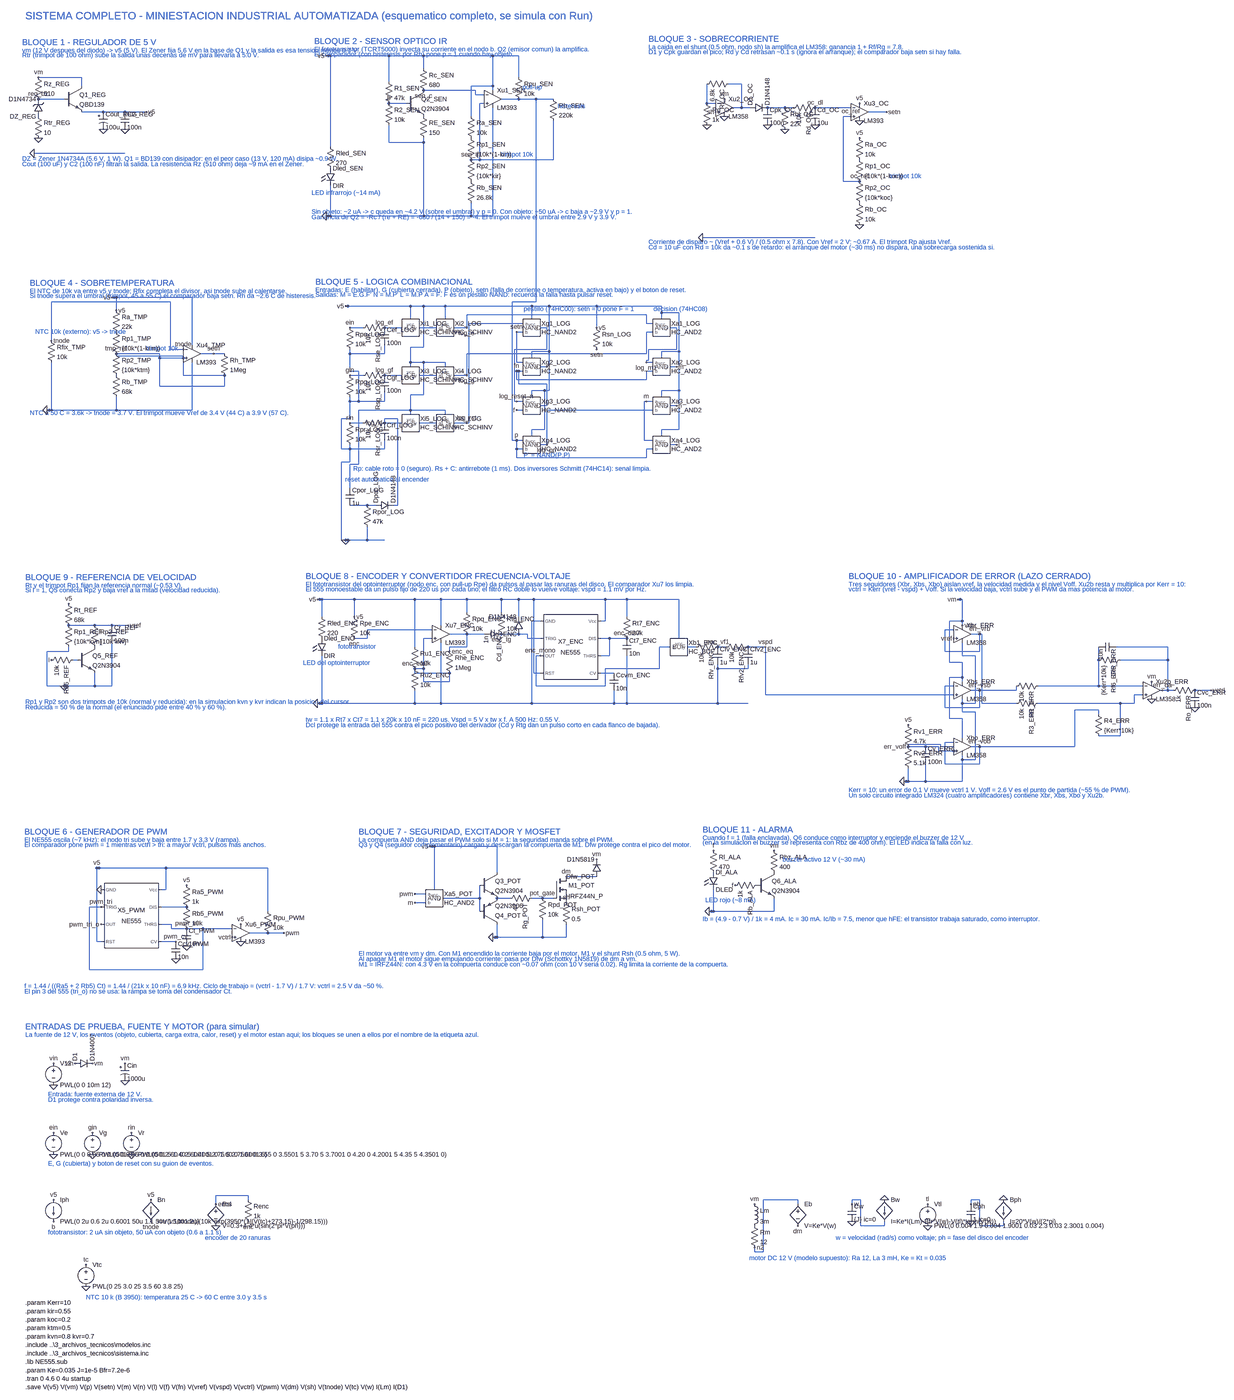
[diagram p0: schematic SISTEMA_COMPLETO.asc, whole sheet]
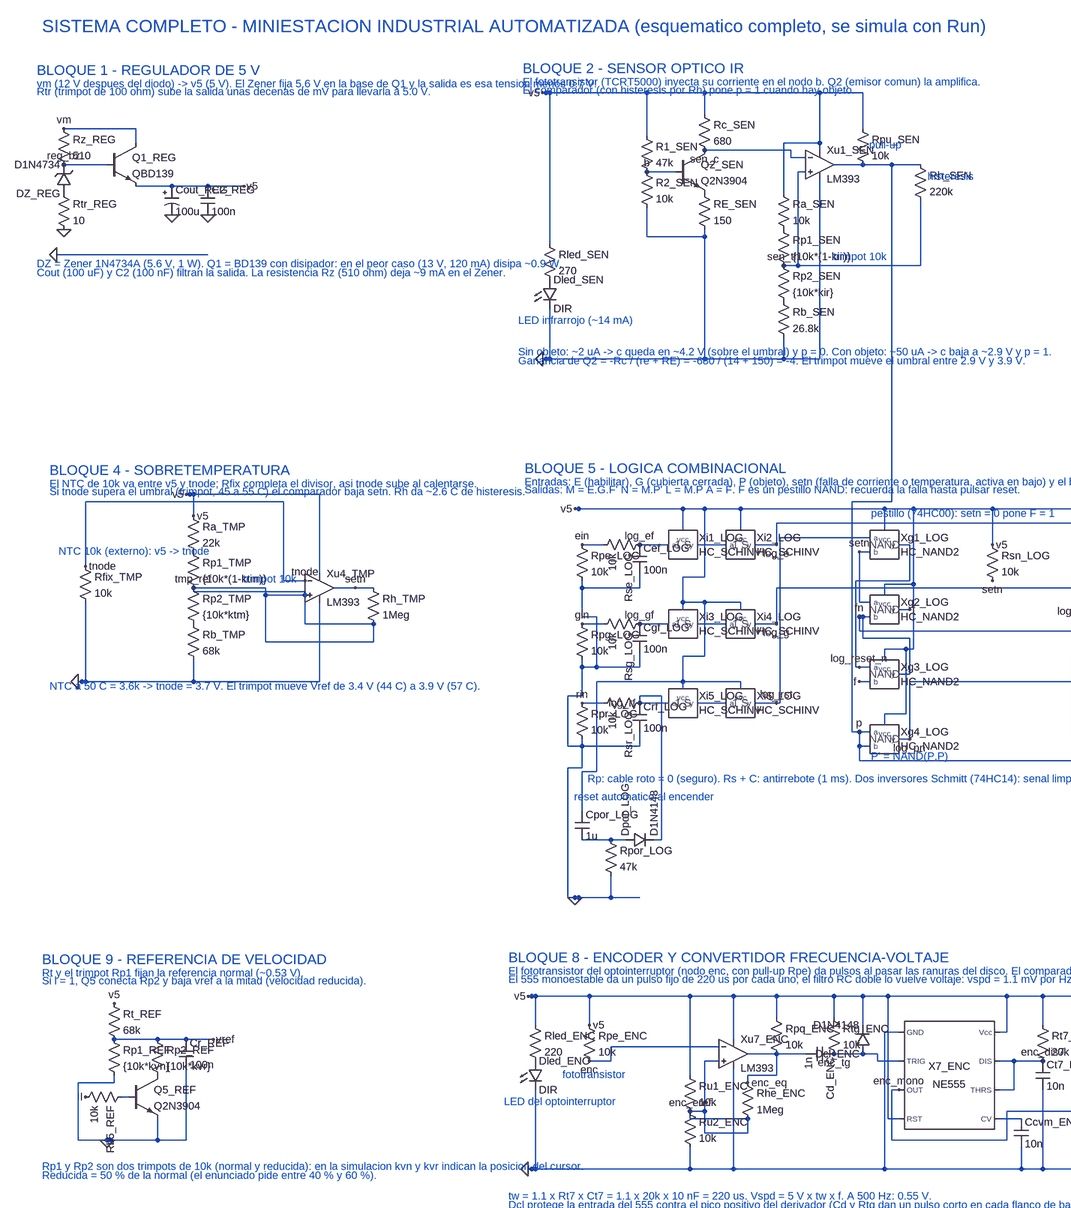
[diagram p1: schematic SISTEMA_COMPLETO.asc, part, row 1 of 2, column 1 of 2]
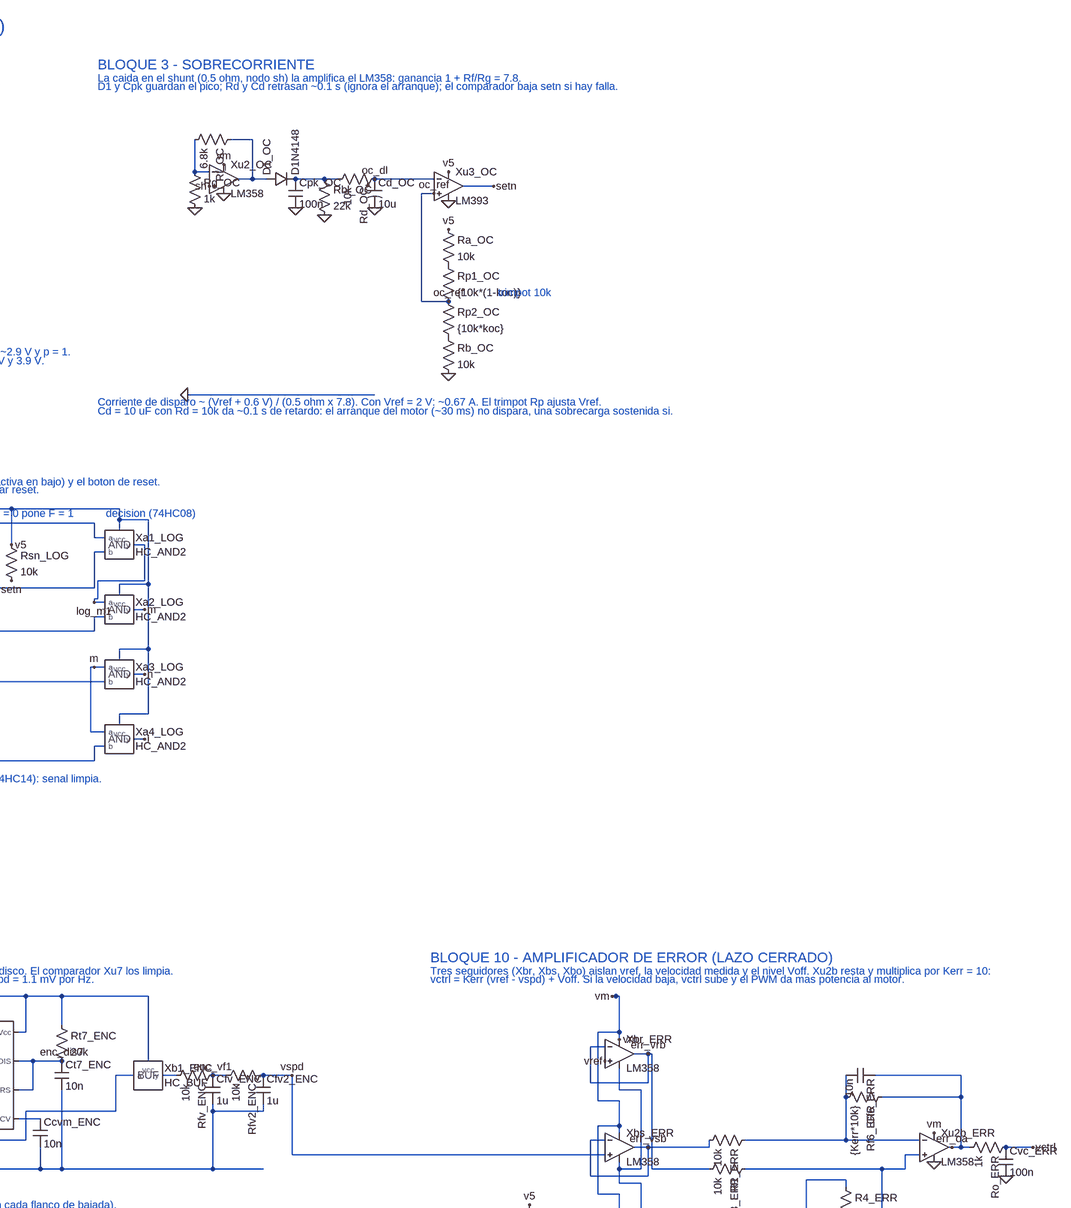
[diagram p2: schematic SISTEMA_COMPLETO.asc, part, row 1 of 2, column 2 of 2]
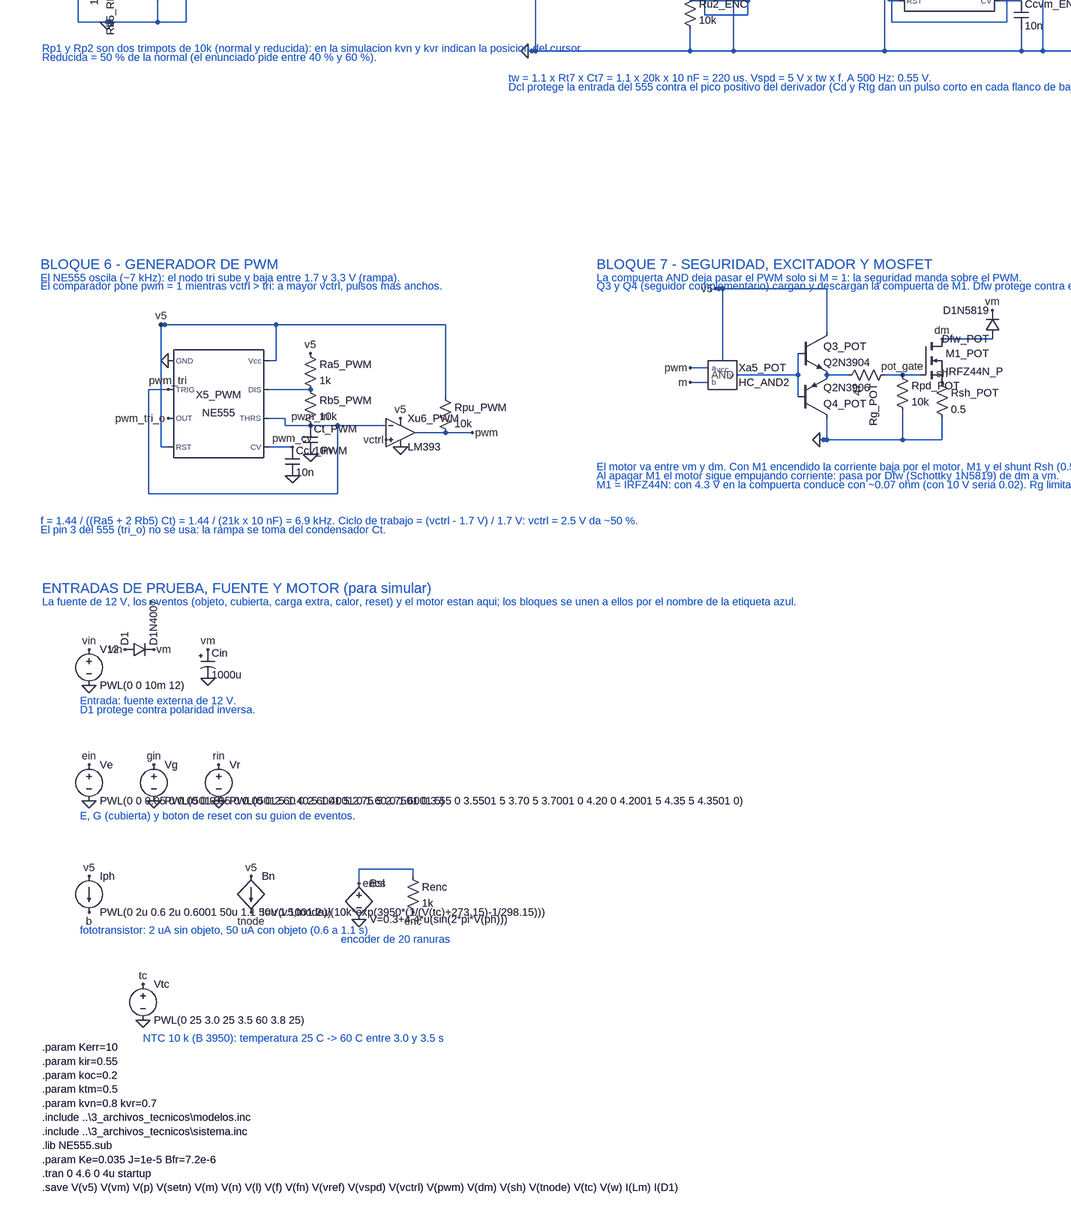
[diagram p3: schematic SISTEMA_COMPLETO.asc, part, row 2 of 2, column 1 of 2]
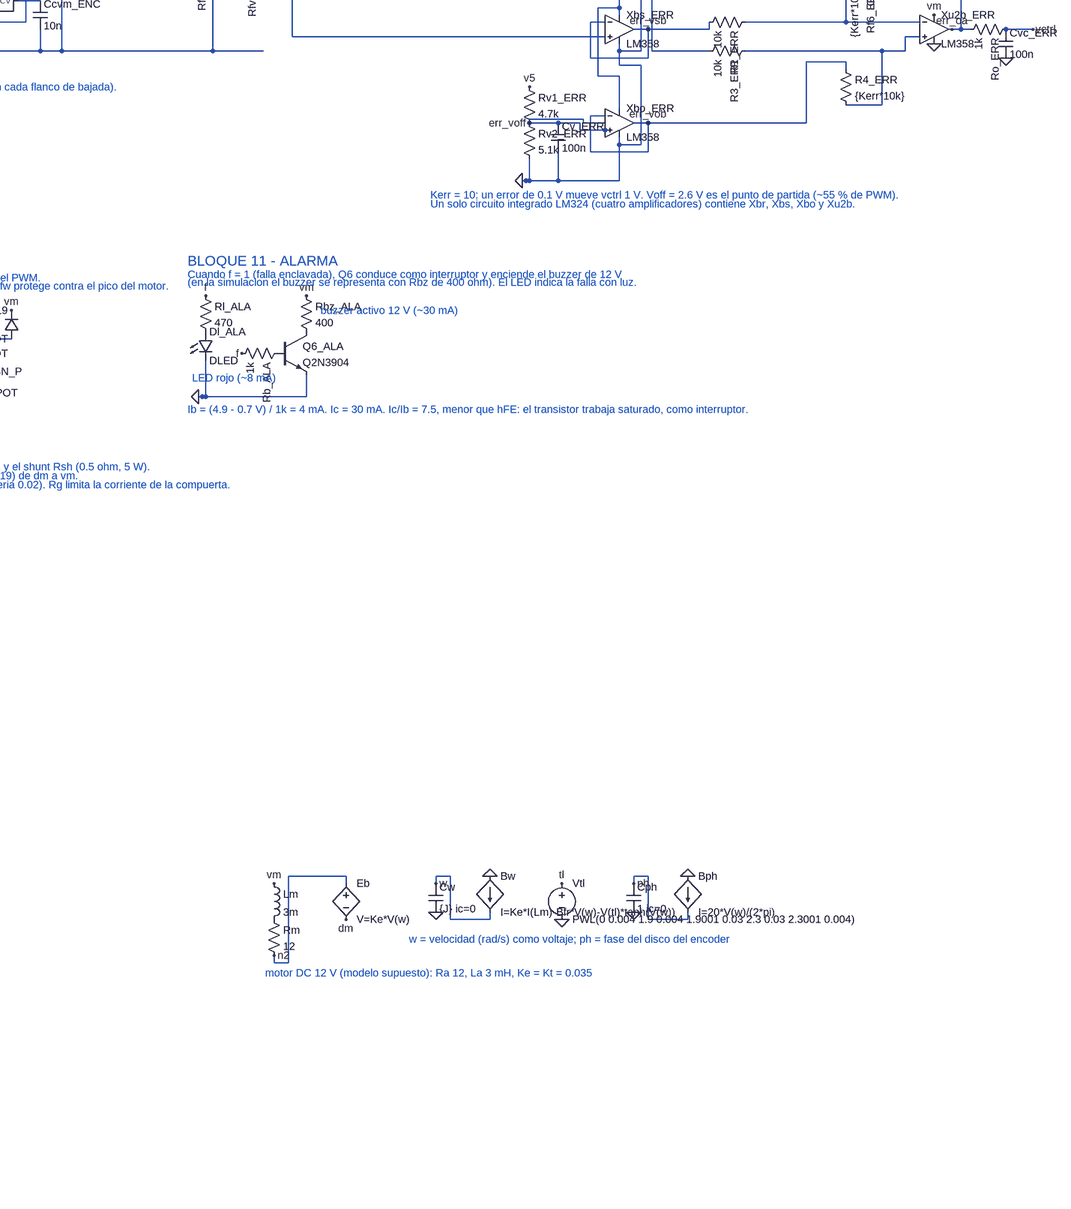
[diagram p4: schematic SISTEMA_COMPLETO.asc, part, row 2 of 2, column 2 of 2]
SISTEMA_COMPLETO.asc, the LTspice schematic file:
Version 4
SHEET 1 9000 5940
WIRE 48 208 144 208
WIRE 48 128 208 128
WIRE 208 128 208 160
WIRE 208 256 448 256
WIRE 32 408 368 408
WIRE 1344 224 1408 224
WIRE 1472 176 1664 176
WIRE 1664 176 1664 192
WIRE 1664 192 1696 192
WIRE 1648 432 1680 432
WIRE 1680 432 1680 224
WIRE 1680 224 1696 224
WIRE 1760 208 1824 208
WIRE 1824 208 1888 208
WIRE 1888 208 1952 208
WIRE 1952 288 1952 432
WIRE 1952 432 1680 432
WIRE 1112 48 1824 48
WIRE 1112 48 1120 48
WIRE 1472 96 1472 48
WIRE 1824 128 1824 48
WIRE 1344 144 1344 48
WIRE 1728 176 1728 48
WIRE 1648 272 1648 160
WIRE 1648 160 1728 160
WIRE 1128 384 1128 48
WIRE 1112 640 1728 640
WIRE 1112 640 1120 640
WIRE 1648 592 1648 640
WIRE 1128 528 1128 640
WIRE 1472 352 1472 640
WIRE 1344 304 1344 368
WIRE 1344 368 1472 368
WIRE 1728 240 1728 640
WIRE 2552 224 2520 224
WIRE 2520 224 2520 152
WIRE 2600 152 2648 152
WIRE 2648 152 2648 240
WIRE 2648 240 2616 240
WIRE 2648 240 2680 240
WIRE 2744 240 2808 240
WIRE 2808 240 2840 240
WIRE 2920 240 3052 240
WIRE 3116 256 3184 256
WIRE 3084 512 3024 512
WIRE 3024 512 3024 272
WIRE 3024 272 3052 272
WIRE 2504 720 2920 720
WIRE 648 1504 696 1504
WIRE 696 1504 736 1504
WIRE 96 1456 96 1312
WIRE 96 1312 536 1312
WIRE 536 1312 536 1488
WIRE 536 1488 584 1488
WIRE 336 1504 496 1504
WIRE 496 1504 496 1520
WIRE 496 1520 584 1520
WIRE 736 1584 736 1624
WIRE 736 1624 496 1624
WIRE 496 1624 496 1520
WIRE 320 1296 616 1296
WIRE 320 1296 328 1296
WIRE 336 1344 336 1296
WIRE 616 1472 616 1296
WIRE 80 1712 616 1712
WIRE 80 1712 88 1712
WIRE 336 1664 336 1712
WIRE 96 1536 96 1712
WIRE 616 1536 616 1712
WIRE 1200 1408 1248 1408
WIRE 1328 1408 1392 1408
WIRE 1456 1408 1520 1408
WIRE 1584 1408 1632 1408
WIRE 1200 1584 1248 1584
WIRE 1328 1584 1392 1584
WIRE 1456 1584 1520 1584
WIRE 1584 1584 1632 1584
WIRE 1200 1760 1248 1760
WIRE 1328 1760 1392 1760
WIRE 1456 1760 1520 1760
WIRE 1584 1760 1632 1760
WIRE 1200 2064 1264 2064
WIRE 1264 2064 1296 2064
WIRE 1904 1408 1928 1408
WIRE 1872 1376 1872 1352
WIRE 1840 1392 1816 1392
WIRE 1840 1424 1816 1424
WIRE 1904 1552 1928 1552
WIRE 1872 1520 1872 1496
WIRE 1840 1536 1816 1536
WIRE 1840 1568 1816 1568
WIRE 1904 1696 1928 1696
WIRE 1872 1664 1872 1640
WIRE 1840 1680 1816 1680
WIRE 1840 1712 1816 1712
WIRE 1904 1840 1928 1840
WIRE 1872 1808 1872 1784
WIRE 1840 1824 1816 1824
WIRE 1840 1856 1816 1856
WIRE 2384 1408 2408 1408
WIRE 2352 1376 2352 1352
WIRE 2320 1392 2296 1392
WIRE 2320 1424 2296 1424
WIRE 2384 1552 2408 1552
WIRE 2352 1520 2352 1496
WIRE 2320 1536 2296 1536
WIRE 2320 1568 2296 1568
WIRE 2384 1696 2408 1696
WIRE 2352 1664 2352 1640
WIRE 2320 1680 2296 1680
WIRE 2320 1712 2296 1712
WIRE 2384 1840 2408 1840
WIRE 2352 1808 2352 1784
WIRE 2320 1824 2296 1824
WIRE 2320 1856 2296 1856
WIRE 2296 1392 2296 1360
WIRE 2296 1360 1632 1360
WIRE 1632 1360 1632 1408
WIRE 2296 1568 2296 1600
WIRE 2296 1600 1816 1600
WIRE 1816 1600 1816 1568
WIRE 2296 1424 2296 1504
WIRE 2296 1504 1632 1504
WIRE 1632 1504 1632 1584
WIRE 2296 1824 2288 1824
WIRE 2288 1824 2288 1680
WIRE 2288 1680 2296 1680
WIRE 2408 1408 2408 1488
WIRE 2408 1488 2304 1488
WIRE 2304 1488 2304 1528
WIRE 2304 1528 2296 1528
WIRE 2296 1528 2296 1536
WIRE 2296 1856 2296 1888
WIRE 2296 1888 1816 1888
WIRE 1816 1888 1816 1856
WIRE 2296 1712 1928 1712
WIRE 1928 1712 1928 1840
WIRE 1928 1408 1928 1488
WIRE 1928 1488 1808 1488
WIRE 1808 1488 1808 1680
WIRE 1808 1680 1816 1680
WIRE 1360 2064 1376 2064
WIRE 1376 2064 1376 1744
WIRE 1376 1744 1328 1744
WIRE 1328 1744 1328 1760
WIRE 1816 1392 1640 1392
WIRE 1640 1392 1640 1760
WIRE 1640 1760 1632 1760
WIRE 1816 1536 1816 1424
WIRE 1184 1328 2352 1328
WIRE 1184 1328 1192 1328
WIRE 1872 1352 1872 1328
WIRE 2352 1352 2352 1328
WIRE 1424 1376 1424 1328
WIRE 1552 1376 1552 1328
WIRE 2112 1408 2112 1328
WIRE 1872 1496 1936 1496
WIRE 1936 1496 1936 1328
WIRE 2352 1496 2416 1496
WIRE 2416 1496 2416 1352
WIRE 2416 1352 2352 1352
WIRE 1872 1640 1936 1640
WIRE 1936 1640 1936 1496
WIRE 2352 1640 2416 1640
WIRE 2416 1640 2416 1496
WIRE 1872 1784 1920 1784
WIRE 1920 1784 1920 1640
WIRE 2352 1784 2416 1784
WIRE 2416 1784 2416 1640
WIRE 1424 1552 1424 1480
WIRE 1424 1480 1472 1480
WIRE 1472 1480 1472 1328
WIRE 1552 1552 1552 1536
WIRE 1552 1536 1424 1536
WIRE 1424 1728 1424 1656
WIRE 1424 1656 1472 1656
WIRE 1472 1656 1472 1536
WIRE 1552 1728 1552 1712
WIRE 1552 1712 1424 1712
WIRE 1200 2000 1200 1912
WIRE 1200 1912 1232 1912
WIRE 1232 1912 1232 1712
WIRE 1232 1712 1424 1712
WIRE 1184 2192 1328 2192
WIRE 1184 2192 1192 2192
WIRE 1264 2144 1264 2192
WIRE 1200 1840 1200 1904
WIRE 1200 1904 1168 1904
WIRE 1168 1904 1168 2192
WIRE 1168 2192 1184 2192
WIRE 1328 1824 1328 1856
WIRE 1328 1856 1200 1856
WIRE 1200 1664 1200 1744
WIRE 1200 1744 1168 1744
WIRE 1168 1744 1168 1856
WIRE 1168 1856 1200 1856
WIRE 1328 1648 1328 1680
WIRE 1328 1680 1200 1680
WIRE 1200 1488 1200 1568
WIRE 1200 1568 1232 1568
WIRE 1232 1568 1232 1680
WIRE 1328 1472 1328 1504
WIRE 1328 1504 1200 1504
WIRE 160 2656 256 2656
WIRE 256 2656 320 2656
WIRE 320 2656 380 2656
WIRE 176 2784 192 2784
WIRE 144 2880 320 2880
WIRE 144 2880 152 2880
WIRE 256 2832 256 2880
WIRE 160 2736 160 2752
WIRE 160 2752 80 2752
WIRE 80 2752 80 2880
WIRE 80 2880 144 2880
WIRE 320 2720 320 2880
WIRE 1216 2704 1264 2704
WIRE 1264 2704 1264 2672
WIRE 1264 2672 1504 2672
WIRE 1440 2816 1472 2816
WIRE 1472 2816 1472 2704
WIRE 1472 2704 1504 2704
WIRE 1568 2688 1632 2688
WIRE 1632 2688 1696 2688
WIRE 1568 2832 1568 2864
WIRE 1568 2864 1472 2864
WIRE 1472 2864 1472 2816
WIRE 1760 2688 1824 2688
WIRE 1824 2688 1856 2688
WIRE 1856 2688 1856 2704
WIRE 1856 2704 1904 2704
WIRE 2128 2704 2160 2704
WIRE 2160 2704 2160 2768
WIRE 2160 2768 2128 2768
WIRE 2160 2704 2224 2704
WIRE 2128 2832 2176 2832
WIRE 2384 2736 2344 2736
WIRE 2448 2736 2480 2736
WIRE 2560 2736 2592 2736
WIRE 2672 2736 2736 2736
WIRE 1632 2688 1632 2736
WIRE 1632 2736 1568 2736
WIRE 1568 2736 1568 2752
WIRE 2344 2736 2344 2816
WIRE 2344 2816 2144 2816
WIRE 2144 2816 2144 2880
WIRE 2144 2880 1888 2880
WIRE 1888 2880 1888 2768
WIRE 1888 2768 1904 2768
WIRE 1080 2560 2416 2560
WIRE 1080 2560 1088 2560
WIRE 1632 2608 1632 2560
WIRE 1760 2608 1760 2560
WIRE 1096 2624 1096 2560
WIRE 1216 2624 1216 2560
WIRE 1824 2624 1824 2560
WIRE 2224 2624 2224 2560
WIRE 2128 2640 2144 2640
WIRE 2144 2640 2144 2560
WIRE 1536 2656 1536 2560
WIRE 2416 2704 2416 2560
WIRE 1440 2736 1440 2560
WIRE 1904 2832 1880 2832
WIRE 1880 2832 1880 2560
WIRE 1080 2944 2672 2944
WIRE 1080 2944 1088 2944
WIRE 1440 2896 1440 2944
WIRE 2176 2896 2176 2944
WIRE 2560 2800 2560 2944
WIRE 2672 2800 2672 2816
WIRE 2672 2816 2560 2816
WIRE 1096 2768 1096 2944
WIRE 2224 2768 2224 2944
WIRE 1536 2720 1536 2944
WIRE 1904 2640 1872 2640
WIRE 1872 2640 1872 2944
WIRE 3496 2688 3528 2688
WIRE 3528 2688 3528 2752
WIRE 3528 2752 3400 2752
WIRE 3400 2752 3400 2672
WIRE 3400 2672 3432 2672
WIRE 3496 2896 3528 2896
WIRE 3528 2896 3528 2960
WIRE 3528 2960 3400 2960
WIRE 3400 2960 3400 2880
WIRE 3400 2880 3432 2880
WIRE 3496 3104 3528 3104
WIRE 3528 3104 3528 3168
WIRE 3528 3168 3400 3168
WIRE 3400 3168 3400 3088
WIRE 3400 3088 3432 3088
WIRE 3264 3104 3328 3104
WIRE 3328 3104 3376 3104
WIRE 3376 3104 3376 3120
WIRE 3376 3120 3432 3120
WIRE 3744 2880 3968 2880
WIRE 3968 2880 4132 2880
WIRE 3744 2944 3968 2944
WIRE 3968 2944 4048 2944
WIRE 4048 2944 4100 2944
WIRE 4100 2944 4100 2912
WIRE 4100 2912 4132 2912
WIRE 3968 3064 4048 3064
WIRE 4048 3064 4048 2944
WIRE 3968 2880 3968 2784
WIRE 4048 2784 4224 2784
WIRE 3968 2784 3968 2736
WIRE 4032 2736 4224 2736
WIRE 4224 2736 4224 2784
WIRE 4224 2784 4224 2896
WIRE 4196 2896 4224 2896
WIRE 4224 2896 4244 2896
WIRE 4324 2896 4384 2896
WIRE 3968 2984 3968 2968
WIRE 3968 2968 3880 2968
WIRE 3880 2968 3880 3104
WIRE 3880 3104 3528 3104
WIRE 3664 2944 3536 2944
WIRE 3536 2944 3536 2688
WIRE 3536 2688 3528 2688
WIRE 3664 2880 3664 2896
WIRE 3664 2896 3528 2896
WIRE 3448 2560 3464 2560
WIRE 3448 2560 3456 2560
WIRE 3464 2656 3464 2560
WIRE 3464 2864 3464 2792
WIRE 3464 2792 3416 2792
WIRE 3416 2792 3416 2640
WIRE 3416 2640 3464 2640
WIRE 3464 3072 3464 3000
WIRE 3464 3000 3416 3000
WIRE 3416 3000 3416 2848
WIRE 3416 2848 3464 2848
WIRE 3248 3232 3464 3232
WIRE 3248 3232 3256 3232
WIRE 3264 3184 3264 3232
WIRE 3328 3168 3328 3232
WIRE 3464 3136 3464 3232
WIRE 3464 2928 3464 2976
WIRE 3464 2976 3512 2976
WIRE 3512 2976 3512 3152
WIRE 3512 3152 3464 3152
WIRE 3464 2720 3464 2768
WIRE 3464 2768 3512 2768
WIRE 3512 2768 3512 2944
WIRE 3512 2944 3464 2944
WIRE 504 3968 596 3968
WIRE 504 4032 540 4032
WIRE 540 4032 540 4048
WIRE 540 4048 596 4048
WIRE 504 4096 556 4096
WIRE 596 4048 656 4048
WIRE 656 4048 764 4048
WIRE 280 3968 236 3968
WIRE 236 3968 236 4200
WIRE 236 4200 656 4200
WIRE 656 4200 656 4048
WIRE 828 4064 896 4064
WIRE 896 4064 956 4064
WIRE 264 3824 896 3824
WIRE 264 3824 272 3824
WIRE 504 3904 520 3904
WIRE 520 3904 520 3824
WIRE 896 3984 896 3824
WIRE 280 4096 264 4096
WIRE 264 4096 264 3824
WIRE 1480 3920 1440 3920
WIRE 1480 3952 1440 3952
WIRE 1544 3936 1680 3936
WIRE 1680 3888 1680 3936
WIRE 1680 3936 1680 3984
WIRE 1744 3936 1792 3936
WIRE 1872 3936 1952 3936
WIRE 2000 3856 2112 3856
WIRE 1496 3744 1744 3744
WIRE 1496 3744 1504 3744
WIRE 1744 3840 1744 3744
WIRE 1512 3904 1512 3744
WIRE 1728 4080 2000 4080
WIRE 1728 4080 1736 4080
WIRE 1744 4032 1744 4080
WIRE 2000 4032 2000 4080
WIRE 1912 4016 1912 4080
WIRE 2528 3984 2768 3984
WIRE 2528 3984 2536 3984
WIRE 2768 3936 2768 3984
WIRE 2544 3904 2544 3984
WIRE 824 5160 824 5144
WIRE 824 5144 704 5144
WIRE 704 5144 704 5176
WIRE 1928 1696 1928 1616
WIRE 1928 1616 1824 1616
WIRE 1824 1616 1824 1568
WIRE 1824 1568 1816 1568
WIRE 2856 5176 2856 5160
WIRE 2856 5160 2728 5160
WIRE 2728 5160 2728 5352
WIRE 2728 5352 2696 5352
WIRE 2696 5352 2696 5336
WIRE 3616 5240 3616 5256
WIRE 3616 5256 3528 5256
WIRE 3528 5256 3528 5160
WIRE 3528 5160 3496 5160
WIRE 3496 5160 3496 5176
WIRE 3432 2912 2736 2912
WIRE 2736 2912 2736 2736
WIRE 3176 5240 3176 5256
WIRE 3176 5256 3088 5256
WIRE 3088 5256 3088 5160
WIRE 3088 5160 3056 5160
WIRE 3056 5160 3056 5176
WIRE 1816 1856 1816 1824
WIRE 1888 208 1888 1312
WIRE 1888 1312 1800 1312
WIRE 1800 1312 1800 1824
WIRE 1800 1824 1816 1824
WIRE 1568 2832 1440 2832
WIRE 1440 2832 1440 2816
WIRE 3432 3120 3432 3104
WIRE 3432 3104 3384 3104
WIRE 3384 3104 3384 3096
WIRE 3384 3096 3264 3096
WIRE 3264 3096 3264 3104
WIRE 584 1520 584 1512
WIRE 584 1512 336 1512
WIRE 336 1512 336 1504
WIRE 736 1584 584 1584
WIRE 584 1584 584 1520
FLAG 48 128 vm
FLAG 48 352 0
FLAG 48 208 reg_bz
FLAG 448 256 v5
FLAG 288 320 0
FLAG 368 320 0
FLAG 32 408 0
FLAG 1344 224 b
FLAG 1472 176 sen_c
FLAG 1648 432 sen_th
FLAG 1112 48 v5
FLAG 1112 640 0
FLAG 2552 256 sh
FLAG 2584 208 vm
FLAG 2584 272 0
FLAG 2520 304 0
FLAG 2744 304 0
FLAG 2808 320 0
FLAG 2920 304 0
FLAG 2920 240 oc_dl
FLAG 3052 272 oc_ref
FLAG 3084 224 v5
FLAG 3084 288 0
FLAG 3184 256 setn
FLAG 3084 352 v5
FLAG 3084 512 oc_ref
FLAG 3084 672 0
FLAG 2504 720 0
FLAG 96 1456 tnode
FLAG 336 1344 v5
FLAG 336 1504 tmp_ref
FLAG 584 1488 tnode
FLAG 696 1504 setn
FLAG 320 1296 v5
FLAG 80 1712 0
FLAG 1200 1408 ein
FLAG 1328 1408 log_ef
FLAG 1632 1408 log_e
FLAG 1200 1584 gin
FLAG 1328 1584 log_gf
FLAG 1632 1584 log_g
FLAG 1200 1760 rin
FLAG 1328 1760 log_rf
FLAG 1632 1760 log_rst
FLAG 1816 1424 setn
FLAG 1928 1552 f
FLAG 1816 1568 fn
FLAG 1816 1680 log_reset_n
FLAG 1816 1712 f
FLAG 1928 1840 log_pn
FLAG 1816 1824 p
FLAG 2112 1408 v5
FLAG 2112 1488 setn
FLAG 2408 1552 m
FLAG 2296 1536 log_m1
FLAG 2408 1696 n
FLAG 2296 1680 m
FLAG 2408 1840 l
FLAG 1184 1328 v5
FLAG 1184 2192 0
FLAG 160 2576 v5
FLAG 380 2656 vref
FLAG 96 2784 l
FLAG 144 2880 0
FLAG 1216 2624 v5
FLAG 1216 2704 enc
FLAG 1440 2816 enc_eref
FLAG 1568 2752 enc_eq
FLAG 1760 2688 enc_tg
FLAG 1904 2768 enc_mono
FLAG 2224 2704 enc_dis7
FLAG 2560 2736 enc_vf1
FLAG 2736 2736 vspd
FLAG 1080 2560 v5
FLAG 1080 2944 0
FLAG 3432 2704 vref
FLAG 3464 2656 vm
FLAG 3528 2688 err_vrb
FLAG 3528 2896 err_vsb
FLAG 3528 3104 err_vob
FLAG 3264 3024 v5
FLAG 3264 3104 err_voff
FLAG 4164 2864 vm
FLAG 4164 2928 0
FLAG 4204 2896 err_oa
FLAG 4324 2960 0
FLAG 4384 2896 vctrl
FLAG 3448 2560 vm
FLAG 3248 3232 0
FLAG 280 3904 0
FLAG 280 3968 pwm_tri
FLAG 280 4032 pwm_tri_o
FLAG 596 3888 v5
FLAG 596 4112 0
FLAG 596 4048 pwm_tri
FLAG 556 4160 0
FLAG 556 4096 pwm_cv
FLAG 764 4080 vctrl
FLAG 796 4032 v5
FLAG 796 4096 0
FLAG 956 4064 pwm
FLAG 264 3824 v5
FLAG 1440 3920 pwm
FLAG 1440 3952 m
FLAG 1912 3936 pot_gate
FLAG 2000 3856 dm
FLAG 2000 3952 sh
FLAG 2112 3792 vm
FLAG 1496 3744 v5
FLAG 1728 4080 0
FLAG 2624 3888 f
FLAG 2768 3760 vm
FLAG 2544 3760 f
FLAG 2528 3984 0
FLAG 104 4656 vin
FLAG 104 4736 0
FLAG 184 4656 vin
FLAG 248 4656 vm
FLAG 368 4656 vm
FLAG 368 4720 0
FLAG 104 4912 ein
FLAG 104 4992 0
FLAG 248 4912 gin
FLAG 248 4992 0
FLAG 392 4912 rin
FLAG 392 4992 0
FLAG 104 5160 v5
FLAG 104 5240 b
FLAG 224 5400 tc
FLAG 224 5480 0
FLAG 464 5160 v5
FLAG 464 5240 tnode
FLAG 704 5176 encs
FLAG 704 5256 0
FLAG 824 5240 enc
FLAG 2696 5176 vm
FLAG 2696 5336 n2
FLAG 2856 5256 dm
FLAG 3056 5176 w
FLAG 3056 5240 0
FLAG 3176 5160 0
FLAG 3336 5176 tl
FLAG 3336 5256 0
FLAG 3496 5176 ph
FLAG 3496 5240 0
FLAG 3616 5160 0
SYMBOL res 32 112 R0
SYMATTR InstName Rz_REG
SYMATTR Value 510
SYMBOL zener 64 272 R180
SYMATTR InstName DZ_REG
SYMATTR Value D1N4734
SYMBOL res 32 256 R0
SYMATTR InstName Rtr_REG
SYMATTR Value 10
SYMBOL npn 144 160 R0
SYMATTR InstName Q1_REG
SYMATTR Value QBD139
SYMBOL polcap 272 256 R0
SYMATTR InstName Cout_REG
SYMATTR Value 100u
SYMBOL cap 352 256 R0
SYMATTR InstName C2_REG
SYMATTR Value 100n
SYMBOL res 1112 368 R0
SYMATTR InstName Rled_SEN
SYMATTR Value 270
SYMBOL LED 1112 464 R0
SYMATTR InstName Dled_SEN
SYMATTR Value DIR
SYMBOL res 1328 128 R0
SYMATTR InstName R1_SEN
SYMATTR Value 47k
SYMBOL res 1328 208 R0
SYMATTR InstName R2_SEN
SYMATTR Value 10k
SYMBOL npn 1408 176 R0
SYMATTR InstName Q2_SEN
SYMATTR Value Q2N3904
SYMBOL res 1456 80 R0
SYMATTR InstName Rc_SEN
SYMATTR Value 680
SYMBOL res 1456 256 R0
SYMATTR InstName RE_SEN
SYMATTR Value 150
SYMBOL res 1632 256 R0
SYMATTR InstName Ra_SEN
SYMATTR Value 10k
SYMBOL res 1632 336 R0
SYMATTR InstName Rp1_SEN
SYMATTR Value {10k*(1-kir)}
SYMBOL res 1632 416 R0
SYMATTR InstName Rp2_SEN
SYMATTR Value {10k*kir}
SYMBOL res 1632 496 R0
SYMATTR InstName Rb_SEN
SYMATTR Value 26.8k
SYMBOL OpAmps\opamp2 1728 144 R0
SYMATTR InstName Xu1_SEN
SYMATTR Value LM393
SYMBOL res 1808 112 R0
SYMATTR InstName Rpu_SEN
SYMATTR Value 10k
SYMBOL res 1936 192 R0
SYMATTR InstName Rh_SEN
SYMATTR Value 220k
SYMBOL OpAmps\opamp2 2584 176 R0
SYMATTR InstName Xu2_OC
SYMATTR Value LM358
SYMBOL res 2504 208 R0
SYMATTR InstName Rg_OC
SYMATTR Value 1k
SYMBOL res 2616 136 R90
SYMATTR InstName Rf_OC
SYMATTR Value 6.8k
SYMBOL diode 2680 256 R270
SYMATTR InstName D1_OC
SYMATTR Value D1N4148
SYMBOL cap 2728 240 R0
SYMATTR InstName Cpk_OC
SYMATTR Value 100n
SYMBOL res 2792 224 R0
SYMATTR InstName Rbl_OC
SYMATTR Value 22k
SYMBOL res 2936 224 R90
SYMATTR InstName Rd_OC
SYMATTR Value 10k
SYMBOL polcap 2904 240 R0
SYMATTR InstName Cd_OC
SYMATTR Value 10u
SYMBOL OpAmps\opamp2 3084 192 R0
SYMATTR InstName Xu3_OC
SYMATTR Value LM393
SYMBOL res 3068 336 R0
SYMATTR InstName Ra_OC
SYMATTR Value 10k
SYMBOL res 3068 416 R0
SYMATTR InstName Rp1_OC
SYMATTR Value {10k*(1-koc)}
SYMBOL res 3068 496 R0
SYMATTR InstName Rp2_OC
SYMATTR Value {10k*koc}
SYMBOL res 3068 576 R0
SYMATTR InstName Rb_OC
SYMATTR Value 10k
SYMBOL res 80 1440 R0
SYMATTR InstName Rfix_TMP
SYMATTR Value 10k
SYMBOL res 320 1328 R0
SYMATTR InstName Ra_TMP
SYMATTR Value 22k
SYMBOL res 320 1408 R0
SYMATTR InstName Rp1_TMP
SYMATTR Value {10k*(1-ktm)}
SYMBOL res 320 1488 R0
SYMATTR InstName Rp2_TMP
SYMATTR Value {10k*ktm}
SYMBOL res 320 1568 R0
SYMATTR InstName Rb_TMP
SYMATTR Value 68k
SYMBOL OpAmps\opamp2 616 1440 R0
SYMATTR InstName Xu4_TMP
SYMATTR Value LM393
SYMBOL res 720 1488 R0
SYMATTR InstName Rh_TMP
SYMATTR Value 1Meg
SYMBOL res 1184 1392 R0
SYMATTR InstName Rpe_LOG
SYMATTR Value 10k
SYMBOL res 1344 1392 R90
SYMATTR InstName Rse_LOG
SYMATTR Value 10k
SYMBOL cap 1312 1408 R0
SYMATTR InstName Cef_LOG
SYMATTR Value 100n
SYMBOL HC_SCHINV 1424 1408 R0
SYMATTR InstName Xi1_LOG
SYMATTR Value HC_SCHINV
SYMBOL HC_SCHINV 1552 1408 R0
SYMATTR InstName Xi2_LOG
SYMATTR Value HC_SCHINV
SYMBOL res 1184 1568 R0
SYMATTR InstName Rpg_LOG
SYMATTR Value 10k
SYMBOL res 1344 1568 R90
SYMATTR InstName Rsg_LOG
SYMATTR Value 10k
SYMBOL cap 1312 1584 R0
SYMATTR InstName Cgf_LOG
SYMATTR Value 100n
SYMBOL HC_SCHINV 1424 1584 R0
SYMATTR InstName Xi3_LOG
SYMATTR Value HC_SCHINV
SYMBOL HC_SCHINV 1552 1584 R0
SYMATTR InstName Xi4_LOG
SYMATTR Value HC_SCHINV
SYMBOL res 1184 1744 R0
SYMATTR InstName Rpr_LOG
SYMATTR Value 10k
SYMBOL res 1344 1744 R90
SYMATTR InstName Rsr_LOG
SYMATTR Value 10k
SYMBOL cap 1312 1760 R0
SYMATTR InstName Crf_LOG
SYMATTR Value 100n
SYMBOL HC_SCHINV 1424 1760 R0
SYMATTR InstName Xi5_LOG
SYMATTR Value HC_SCHINV
SYMBOL HC_SCHINV 1552 1760 R0
SYMATTR InstName Xi6_LOG
SYMATTR Value HC_SCHINV
SYMBOL cap 1184 2000 R0
SYMATTR InstName Cpor_LOG
SYMATTR Value 1u
SYMBOL res 1248 2048 R0
SYMATTR InstName Rpor_LOG
SYMATTR Value 47k
SYMBOL diode 1296 2080 R270
SYMATTR InstName Dpor_LOG
SYMATTR Value D1N4148
SYMBOL HC_NAND2 1872 1408 R0
SYMATTR InstName Xg1_LOG
SYMATTR Value HC_NAND2
SYMBOL HC_NAND2 1872 1552 R0
SYMATTR InstName Xg2_LOG
SYMATTR Value HC_NAND2
SYMBOL HC_NAND2 1872 1696 R0
SYMATTR InstName Xg3_LOG
SYMATTR Value HC_NAND2
SYMBOL HC_NAND2 1872 1840 R0
SYMATTR InstName Xg4_LOG
SYMATTR Value HC_NAND2
SYMBOL res 2096 1392 R0
SYMATTR InstName Rsn_LOG
SYMATTR Value 10k
SYMBOL HC_AND2 2352 1408 R0
SYMATTR InstName Xa1_LOG
SYMATTR Value HC_AND2
SYMBOL HC_AND2 2352 1552 R0
SYMATTR InstName Xa2_LOG
SYMATTR Value HC_AND2
SYMBOL HC_AND2 2352 1696 R0
SYMATTR InstName Xa3_LOG
SYMATTR Value HC_AND2
SYMBOL HC_AND2 2352 1840 R0
SYMATTR InstName Xa4_LOG
SYMATTR Value HC_AND2
SYMBOL res 144 2560 R0
SYMATTR InstName Rt_REF
SYMATTR Value 68k
SYMBOL res 144 2640 R0
SYMATTR InstName Rp1_REF
SYMATTR Value {10k*kvn}
SYMBOL res 240 2640 R0
SYMATTR InstName Rp2_REF
SYMATTR Value {10k*kvr}
SYMBOL npn 192 2736 R0
SYMATTR InstName Q5_REF
SYMATTR Value Q2N3904
SYMBOL res 192 2768 R90
SYMATTR InstName Rb5_REF
SYMATTR Value 10k
SYMBOL cap 304 2656 R0
SYMATTR InstName Cr_REF
SYMATTR Value 100n
SYMBOL res 1080 2608 R0
SYMATTR InstName Rled_ENC
SYMATTR Value 220
SYMBOL LED 1080 2704 R0
SYMATTR InstName Dled_ENC
SYMATTR Value DIR
SYMBOL res 1200 2608 R0
SYMATTR InstName Rpe_ENC
SYMATTR Value 10k
SYMBOL OpAmps\opamp2 1536 2624 R0
SYMATTR InstName Xu7_ENC
SYMATTR Value LM393
SYMBOL res 1424 2720 R0
SYMATTR InstName Ru1_ENC
SYMATTR Value 10k
SYMBOL res 1424 2800 R0
SYMATTR InstName Ru2_ENC
SYMATTR Value 10k
SYMBOL res 1616 2592 R0
SYMATTR InstName Rpq_ENC
SYMATTR Value 10k
SYMBOL res 1552 2736 R0
SYMATTR InstName Rhe_ENC
SYMATTR Value 1Meg
SYMBOL cap 1760 2672 R90
SYMATTR InstName Cd_ENC
SYMATTR Value 1n
SYMBOL res 1744 2592 R0
SYMATTR InstName Rtg_ENC
SYMATTR Value 10k
SYMBOL diode 1840 2688 R180
SYMATTR InstName Dcl_ENC
SYMATTR Value D1N4148
SYMBOL Misc\NE555 2016 2736 R0
SYMATTR InstName X7_ENC
SYMATTR Value NE555
SYMBOL res 2208 2608 R0
SYMATTR InstName Rt7_ENC
SYMATTR Value 20k
SYMBOL cap 2208 2704 R0
SYMATTR InstName Ct7_ENC
SYMATTR Value 10n
SYMBOL cap 2160 2832 R0
SYMATTR InstName Ccvm_ENC
SYMATTR Value 10n
SYMBOL HC_BUF 2416 2736 R0
SYMATTR InstName Xb1_ENC
SYMATTR Value HC_BUF
SYMBOL res 2576 2720 R90
SYMATTR InstName Rfv_ENC
SYMATTR Value 10k
SYMBOL cap 2544 2736 R0
SYMATTR InstName Cfv_ENC
SYMATTR Value 1u
SYMBOL res 2688 2720 R90
SYMATTR InstName Rfv2_ENC
SYMATTR Value 10k
SYMBOL cap 2656 2736 R0
SYMATTR InstName Cfv2_ENC
SYMATTR Value 1u
SYMBOL OpAmps\opamp2 3464 2624 R0
SYMATTR InstName Xbr_ERR
SYMATTR Value LM358
SYMBOL OpAmps\opamp2 3464 2832 R0
SYMATTR InstName Xbs_ERR
SYMATTR Value LM358
SYMBOL OpAmps\opamp2 3464 3040 R0
SYMATTR InstName Xbo_ERR
SYMATTR Value LM358
SYMBOL res 3248 3008 R0
SYMATTR InstName Rv1_ERR
SYMATTR Value 4.7k
SYMBOL res 3248 3088 R0
SYMATTR InstName Rv2_ERR
SYMATTR Value 5.1k
SYMBOL cap 3312 3104 R0
SYMATTR InstName Cv_ERR
SYMATTR Value 100n
SYMBOL res 3760 2864 R90
SYMATTR InstName R1_ERR
SYMATTR Value 10k
SYMBOL res 3760 2928 R90
SYMATTR InstName R3_ERR
SYMATTR Value 10k
SYMBOL res 3952 2968 R0
SYMATTR InstName R4_ERR
SYMATTR Value {Kerr*10k}
SYMBOL res 4064 2768 R90
SYMATTR InstName Rf6_ERR
SYMATTR Value {Kerr*10k}
SYMBOL cap 4032 2720 R90
SYMATTR InstName Cf6_ERR
SYMATTR Value 10n
SYMBOL OpAmps\opamp2 4164 2832 R0
SYMATTR InstName Xu2b_ERR
SYMATTR Value LM358
SYMBOL res 4340 2880 R90
SYMATTR InstName Ro_ERR
SYMATTR Value 1k
SYMBOL cap 4308 2896 R0
SYMATTR InstName Cvc_ERR
SYMATTR Value 100n
SYMBOL Misc\NE555 392 4000 R0
SYMATTR InstName X5_PWM
SYMATTR Value NE555
SYMBOL res 580 3872 R0
SYMATTR InstName Ra5_PWM
SYMATTR Value 1k
SYMBOL res 580 3952 R0
SYMATTR InstName Rb5_PWM
SYMATTR Value 10k
SYMBOL cap 580 4048 R0
SYMATTR InstName Ct_PWM
SYMATTR Value 10n
SYMBOL cap 540 4096 R0
SYMATTR InstName Ccv_PWM
SYMATTR Value 10n
SYMBOL OpAmps\opamp2 796 4000 R0
SYMATTR InstName Xu6_PWM
SYMATTR Value LM393
SYMBOL res 880 3968 R0
SYMATTR InstName Rpu_PWM
SYMATTR Value 10k
SYMBOL HC_AND2 1512 3936 R0
SYMATTR InstName Xa5_POT
SYMATTR Value HC_AND2
SYMBOL npn 1680 3840 R0
SYMATTR InstName Q3_POT
SYMATTR Value Q2N3904
SYMBOL pnp 1680 4032 M180
SYMATTR InstName Q4_POT
SYMATTR Value Q2N3906
SYMBOL res 1888 3920 R90
SYMATTR InstName Rg_POT
SYMATTR Value 47
SYMBOL res 1896 3920 R0
SYMATTR InstName Rpd_POT
SYMATTR Value 10k
SYMBOL nmos 1952 3856 R0
SYMATTR InstName M1_POT
SYMATTR Value IRFZ44N_P
SYMBOL diode 2128 3856 R180
SYMATTR InstName Dfw_POT
SYMATTR Value D1N5819
SYMBOL res 1984 3936 R0
SYMATTR InstName Rsh_POT
SYMATTR Value 0.5
SYMBOL res 2720 3872 R90
SYMATTR InstName Rb_ALA
SYMATTR Value 1k
SYMBOL npn 2704 3840 R0
SYMATTR InstName Q6_ALA
SYMATTR Value Q2N3904
SYMBOL res 2752 3744 R0
SYMATTR InstName Rbz_ALA
SYMATTR Value 400
SYMBOL res 2528 3744 R0
SYMATTR InstName Rl_ALA
SYMATTR Value 470
SYMBOL LED 2528 3840 R0
SYMATTR InstName Dl_ALA
SYMATTR Value DLED
SYMBOL voltage 104 4640 R0
SYMATTR InstName V12
SYMATTR Value PWL(0 0 10m 12)
SYMBOL diode 184 4672 R270
SYMATTR InstName D1
SYMATTR Value D1N4007
SYMBOL polcap 352 4656 R0
SYMATTR InstName Cin
SYMATTR Value 1000u
SYMBOL voltage 104 4896 R0
SYMATTR InstName Ve
SYMATTR Value PWL(0 0 0.05 0 0.0501 5)
SYMBOL voltage 248 4896 R0
SYMATTR InstName Vg
SYMATTR Value PWL(0 0 0.05 0 0.0501 5 1.40 5 1.4001 0 1.60 0 1.6001 5)
SYMBOL voltage 392 4896 R0
SYMATTR InstName Vr
SYMATTR Value PWL(0 0 2.60 0 2.6001 5 2.75 5 2.7501 0 3.55 0 3.5501 5 3.70 5 3.7001 0 4.20 0 4.2001 5 4.35 5 4.3501 0)
SYMBOL current 104 5160 R0
SYMATTR InstName Iph
SYMATTR Value PWL(0 2u 0.6 2u 0.6001 50u 1.1 50u 1.1001 2u)
SYMBOL voltage 224 5384 R0
SYMATTR InstName Vtc
SYMATTR Value PWL(0 25 3.0 25 3.5 60 3.8 25)
SYMBOL bi 464 5160 R0
SYMATTR InstName Bn
SYMATTR Value I=V(v5,tnode)/(10k*exp(3950*(1/(V(tc)+273.15)-1/298.15)))
SYMBOL bv 704 5160 R0
SYMATTR InstName Bsl
SYMATTR Value V=0.3+4.4*u(sin(2*pi*V(ph)))
SYMBOL res 808 5144 R0
SYMATTR InstName Renc
SYMATTR Value 1k
SYMBOL ind 2680 5160 R0
SYMATTR InstName Lm
SYMATTR Value 3m
SYMBOL res 2680 5240 R0
SYMATTR InstName Rm
SYMATTR Value 12
SYMBOL bv 2856 5160 R0
SYMATTR InstName Eb
SYMATTR Value V=Ke*V(w)
SYMBOL cap 3040 5176 R0
SYMATTR InstName Cw
SYMATTR Value {J} ic=0
SYMBOL bi 3176 5160 R0
SYMATTR InstName Bw
SYMATTR Value I=Ke*I(Lm)-Bfr*V(w)-V(tl)*tanh(V(w))
SYMBOL voltage 3336 5160 R0
SYMATTR InstName Vtl
SYMATTR Value PWL(0 0.004 1.9 0.004 1.9001 0.03 2.3 0.03 2.3001 0.004)
SYMBOL cap 3480 5176 R0
SYMATTR InstName Cph
SYMATTR Value 1 ic=0
SYMBOL bi 3616 5160 R0
SYMATTR InstName Bph
SYMATTR Value I=20*V(w)/(2*pi)
TEXT -12 -2 Left 3 ;BLOQUE 1 - REGULADOR DE 5 V
TEXT -12 28 Left 2 ;vm (12 V despues del diodo) -> v5 (5 V). El Zener fija 5.6 V en la base de Q1 y la salida es esa tension menos 0.7 V.
TEXT -12 46 Left 2 ;Rtr (trimpot de 100 ohm) sube la salida unas decenas de mV para llevarla a 5.0 V.
TEXT -12 428 Left 2 ;DZ = Zener 1N4734A (5.6 V, 1 W). Q1 = BD139 con disipador: en el peor caso (13 V, 120 mA) disipa ~0.9 W.
TEXT -12 448 Left 2 ;Cout (100 uF) y C2 (100 nF) filtran la salida. La resistencia Rz (510 ohm) deja ~9 mA en el Zener.
TEXT 1068 -6 Left 3 ;BLOQUE 2 - SENSOR OPTICO IR
TEXT 1068 24 Left 2 ;El fototransistor (TCRT5000) inyecta su corriente en el nodo b. Q2 (emisor comun) la amplifica.
TEXT 1068 42 Left 2 ;El comparador (con histeresis por Rh) pone p = 1 cuando hay objeto.
TEXT 1058 554 Left 2 ;LED infrarrojo (~14 mA)
TEXT 1758 412 Left 2 ;trimpot 10k
TEXT 1968 234 Left 2 ;histeresis
TEXT 1838 164 Left 2 ;pull-up
TEXT 1058 624 Left 2 ;Sin objeto: ~2 uA -> c queda en ~4.2 V (sobre el umbral) y p = 0. Con objeto: ~50 uA -> c baja a ~2.9 V y p = 1.
TEXT 1058 644 Left 2 ;Ganancia de Q2 = -Rc / (re + RE) = -680 / (14 + 150) = -4. El trimpot mueve el umbral entre 2.9 V y 3.9 V.
TEXT 2304 -14 Left 3 ;BLOQUE 3 - SOBRECORRIENTE
TEXT 2304 16 Left 2 ;La caida en el shunt (0.5 ohm, nodo sh) la amplifica el LM358: ganancia 1 + Rf/Rg = 7.8.
TEXT 2304 34 Left 2 ;D1 y Cpk guardan el pico; Rd y Cd retrasan ~0.1 s (ignora el arranque); el comparador baja setn si hay falla.
TEXT 3194 492 Left 2 ;trimpot 10k
TEXT 2304 736 Left 2 ;Corriente de disparo ~ (Vref + 0.6 V) / (0.5 ohm x 7.8). Con Vref = 2 V: ~0.67 A. El trimpot Rp ajusta Vref.
TEXT 2304 756 Left 2 ;Cd = 10 uF con Rd = 10k da ~0.1 s de retardo: el arranque del motor (~30 ms) no dispara, una sobrecarga sostenida si.
TEXT 16 1242 Left 3 ;BLOQUE 4 - SOBRETEMPERATURA
TEXT 16 1272 Left 2 ;El NTC de 10k va entre v5 y tnode; Rfix completa el divisor, asi tnode sube al calentarse.
TEXT 16 1290 Left 2 ;Si tnode supera el umbral (trimpot, 45 a 55 C) el comparador baja setn. Rh da ~2.6 C de histeresis.
TEXT 36 1422 Left 2 ;NTC 10k (externo): v5 -> tnode
TEXT 446 1484 Left 2 ;trimpot 10k
TEXT 16 1722 Left 2 ;NTC a 50 C = 3.6k -> tnode = 3.7 V. El trimpot mueve Vref de 3.4 V (44 C) a 3.9 V (57 C).
TEXT 1072 1238 Left 3 ;BLOQUE 5 - LOGICA COMBINACIONAL
TEXT 1072 1268 Left 2 ;Entradas: E (habilitar), G (cubierta cerrada), P (objeto), setn (falla de corriente o temperatura, activa en bajo) y el boton de reset.
TEXT 1072 1286 Left 2 ;Salidas: M = E.G.F' N = M.P' L = M.P A = F. F es un pestillo NAND: recuerda la falla hasta pulsar reset.
TEXT 1212 1928 Left 2 ;Rp: cable roto = 0 (seguro). Rs + C: antirrebote (1 ms). Dos inversores Schmitt (74HC14): senal limpia.
TEXT 1182 1968 Left 2 ;reset automatico al encender
TEXT 1842 1338 Left 2 ;pestillo (74HC00): setn = 0 pone F = 1
TEXT 1842 1878 Left 2 ;P' = NAND(P,P)
TEXT 2322 1338 Left 2 ;decision (74HC08)
TEXT 0 2478 Left 3 ;BLOQUE 9 - REFERENCIA DE VELOCIDAD
TEXT 0 2508 Left 2 ;Rt y el trimpot Rp1 fijan la referencia normal (~0.53 V).
TEXT 0 2526 Left 2 ;Si l = 1, Q5 conecta Rp2 y baja vref a la mitad (velocidad reducida).
TEXT 0 2938 Left 2 ;Rp1 y Rp2 son dos trimpots de 10k (normal y reducida): en la simulacion kvn y kvr indican la posicion del cursor.
TEXT 0 2958 Left 2 ;Reducida = 50 % de la normal (el enunciado pide entre 40 % y 60 %).
TEXT 1036 2474 Left 3 ;BLOQUE 8 - ENCODER Y CONVERTIDOR FRECUENCIA-VOLTAJE
TEXT 1036 2504 Left 2 ;El fototransistor del optointerruptor (nodo enc, con pull-up Rpe) da pulsos al pasar las ranuras del disco. El comparador Xu7 los limpia.
TEXT 1036 2522 Left 2 ;El 555 monoestable da un pulso fijo de 220 us por cada uno; el filtro RC doble lo vuelve voltaje: vspd = 1.1 mV por Hz.
TEXT 1026 2794 Left 2 ;LED del optointerruptor
TEXT 1156 2734 Left 2 ;fototransistor
TEXT 1036 3004 Left 2 ;tw = 1.1 x Rt7 x Ct7 = 1.1 x 20k x 10 nF = 220 us. Vspd = 5 V x tw x f. A 500 Hz: 0.55 V.
TEXT 1036 3024 Left 2 ;Dcl protege la entrada del 555 contra el pico positivo del derivador (Cd y Rtg dan un pulso corto en cada flanco de bajada).
TEXT 3044 2474 Left 3 ;BLOQUE 10 - AMPLIFICADOR DE ERROR (LAZO CERRADO)
TEXT 3044 2504 Left 2 ;Tres seguidores (Xbr, Xbs, Xbo) aislan vref, la velocidad medida y el nivel Voff. Xu2b resta y multiplica por Kerr = 10:
TEXT 3044 2522 Left 2 ;vctrl = Kerr (vref - vspd) + Voff. Si la velocidad baja, vctrl sube y el PWM da mas potencia al motor.
TEXT 3044 3264 Left 2 ;Kerr = 10: un error de 0.1 V mueve vctrl 1 V. Voff = 2.6 V es el punto de partida (~55 % de PWM).
TEXT 3044 3284 Left 2 ;Un solo circuito integrado LM324 (cuatro amplificadores) contiene Xbr, Xbs, Xbo y Xu2b.
TEXT -4 3690 Left 3 ;BLOQUE 6 - GENERADOR DE PWM
TEXT -4 3720 Left 2 ;El NE555 oscila (~7 kHz): el nodo tri sube y baja entre 1.7 y 3.3 V (rampa).
TEXT -4 3738 Left 2 ;El comparador pone pwm = 1 mientras vctrl > tri: a mayor vctrl, pulsos mas anchos.
TEXT -4 4260 Left 2 ;f = 1.44 / ((Ra5 + 2 Rb5) Ct) = 1.44 / (21k x 10 nF) = 6.9 kHz. Ciclo de trabajo = (vctrl - 1.7 V) / 1.7 V: vctrl = 2.5 V da ~50 %.
TEXT -4 4280 Left 2 ;El pin 3 del 555 (tri_o) no se usa: la rampa se toma del condensador Ct.
TEXT 1232 3690 Left 3 ;BLOQUE 7 - SEGURIDAD, EXCITADOR Y MOSFET
TEXT 1232 3720 Left 2 ;La compuerta AND deja pasar el PWM solo si M = 1: la seguridad manda sobre el PWM.
TEXT 1232 3738 Left 2 ;Q3 y Q4 (seguidor complementario) cargan y descargan la compuerta de M1. Dfw protege contra el pico del motor.
TEXT 1232 4140 Left 2 ;El motor va entre vm y dm. Con M1 encendido la corriente baja por el motor, M1 y el shunt Rsh (0.5 ohm, 5 W).
TEXT 1232 4160 Left 2 ;Al apagar M1 el motor sigue empujando corriente: pasa por Dfw (Schottky 1N5819) de dm a vm.
TEXT 1232 4180 Left 2 ;M1 = IRFZ44N: con 4.3 V en la compuerta conduce con ~0.07 ohm (con 10 V seria 0.02). Rg limita la corriente de la compuerta.
TEXT 2504 3682 Left 3 ;BLOQUE 11 - ALARMA
TEXT 2504 3712 Left 2 ;Cuando f = 1 (falla enclavada), Q6 conduce como interruptor y enciende el buzzer de 12 V
TEXT 2504 3730 Left 2 ;(en la simulacion el buzzer se representa con Rbz de 400 ohm). El LED indica la falla con luz.
TEXT 2800 3792 Left 2 ;buzzer activo 12 V (~30 mA)
TEXT 2514 3942 Left 2 ;LED rojo (~8 mA)
TEXT 2504 4012 Left 2 ;Ib = (4.9 - 0.7 V) / 1k = 4 mA. Ic = 30 mA. Ic/Ib = 7.5, menor que hFE: el transistor trabaja saturado, como interruptor.
TEXT 0 4520 Left 3 ;ENTRADAS DE PRUEBA, FUENTE Y MOTOR (para simular)
TEXT 0 4550 Left 2 ;La fuente de 12 V, los eventos (objeto, cubierta, carga extra, calor, reset) y el motor estan aqui; los bloques se unen a ellos por el nombre de la etiqueta azul.
TEXT 84 4770 Left 2 ;Entrada: fuente externa de 12 V.
TEXT 84 4790 Left 2 ;D1 protege contra polaridad inversa.
TEXT 84 5026 Left 2 ;E, G (cubierta) y boton de reset con su guion de eventos.
TEXT 84 5280 Left 2 ;fototransistor: 2 uA sin objeto, 50 uA con objeto (0.6 a 1.1 s)
TEXT 224 5520 Left 2 ;NTC 10 k (B 3950): temperatura 25 C -> 60 C entre 3.0 y 3.5 s
TEXT 664 5300 Left 2 ;encoder de 20 ranuras
TEXT 2676 5375 Left 2 ;motor DC 12 V (modelo supuesto): Ra 12, La 3 mH, Ke = Kt = 0.035
TEXT 2996 5300 Left 2 ;w = velocidad (rad/s) como voltaje; ph = fase del disco del encoder
TEXT 0 -100 Left 4 ;SISTEMA COMPLETO - MINIESTACION INDUSTRIAL AUTOMATIZADA (esquematico completo, se simula con Run)
TEXT 0 5540 Left 2 !.param Kerr=10\n.param kir=0.55\n.param koc=0.2\n.param ktm=0.5\n.param kvn=0.8 kvr=0.7\n.include ..\3_archivos_tecnicos\modelos.inc\n.include ..\3_archivos_tecnicos\sistema.inc\n.lib NE555.sub\n.param Ke=0.035 J=1e-5 Bfr=7.2e-6\n.tran 0 4.6 0 4u startup\n.save V(v5) V(vm) V(p) V(setn) V(m) V(n) V(l) V(f) V(fn) V(vref) V(vspd) V(vctrl) V(pwm) V(dm) V(sh) V(tnode) V(tc) V(w) I(Lm) I(D1)

The netlist it stands for:
* SISTEMA_COMPLETO.asc
Rz_REG vm reg_bz 510
DZ_REG P001 reg_bz D1N4734
Rtr_REG P001 0 10
Q1_REG vm reg_bz v5 0 QBD139
Cout_REG v5 0 100u
C2_REG v5 0 100n
Rled_SEN v5 P002 270
Dled_SEN P002 0 DIR
R1_SEN v5 b 47k
R2_SEN b 0 10k
Q2_SEN sen_c b P003 0 Q2N3904
Rc_SEN v5 sen_c 680
RE_SEN P003 0 150
Ra_SEN v5 P004 10k
Rp1_SEN P004 sen_th {10k*(1-kir)}
Rp2_SEN sen_th P005 {10k*kir}
Rb_SEN P005 0 26.8k
XXu1_SEN sen_th sen_c v5 0 p LM393  ; pins In+ In- V+ V- OUT
Rpu_SEN v5 p 10k
Rh_SEN p sen_th 220k
XXu2_OC sh N001 vm 0 N002 LM358  ; pins In+ In- V+ V- OUT
Rg_OC N001 0 1k
Rf_OC N002 N001 6.8k
D1_OC N002 N003 D1N4148
Cpk_OC N003 0 100n
Rbl_OC N003 0 22k
Rd_OC oc_dl N003 10k
Cd_OC oc_dl 0 10u
XXu3_OC oc_ref oc_dl v5 0 setn LM393  ; pins In+ In- V+ V- OUT
Ra_OC v5 P006 10k
Rp1_OC P006 oc_ref {10k*(1-koc)}
Rp2_OC oc_ref P007 {10k*koc}
Rb_OC P007 0 10k
Rfix_TMP tnode 0 10k
Ra_TMP v5 P008 22k
Rp1_TMP P008 tmp_ref {10k*(1-ktm)}
Rp2_TMP tmp_ref P009 {10k*ktm}
Rb_TMP P009 0 68k
XXu4_TMP tmp_ref tnode v5 0 setn LM393  ; pins In+ In- V+ V- OUT
Rh_TMP setn tmp_ref 1Meg
Rpe_LOG ein 0 10k
Rse_LOG log_ef ein 10k
Cef_LOG log_ef 0 100n
XXi1_LOG log_ef N004 v5 HC_SCHINV  ; pins a y vcc
XXi2_LOG N004 log_e v5 HC_SCHINV  ; pins a y vcc
Rpg_LOG gin 0 10k
Rsg_LOG log_gf gin 10k
Cgf_LOG log_gf 0 100n
XXi3_LOG log_gf N005 v5 HC_SCHINV  ; pins a y vcc
XXi4_LOG N005 log_g v5 HC_SCHINV  ; pins a y vcc
Rpr_LOG rin 0 10k
Rsr_LOG log_rf rin 10k
Crf_LOG log_rf 0 100n
XXi5_LOG log_rf N006 v5 HC_SCHINV  ; pins a y vcc
XXi6_LOG N006 log_rst v5 HC_SCHINV  ; pins a y vcc
Cpor_LOG v5 N007 1u
Rpor_LOG N007 0 47k
Dpor_LOG N007 log_rf D1N4148
XXg1_LOG log_rst setn log_reset_n v5 HC_NAND2  ; pins a b y vcc
XXg2_LOG setn fn f v5 HC_NAND2  ; pins a b y vcc
XXg3_LOG log_reset_n f fn v5 HC_NAND2  ; pins a b y vcc
XXg4_LOG p p log_pn v5 HC_NAND2  ; pins a b y vcc
Rsn_LOG v5 setn 10k
XXa1_LOG log_e log_g log_m1 v5 HC_AND2  ; pins a b y vcc
XXa2_LOG log_m1 fn m v5 HC_AND2  ; pins a b y vcc
XXa3_LOG m log_pn n v5 HC_AND2  ; pins a b y vcc
XXa4_LOG m p l v5 HC_AND2  ; pins a b y vcc
Rt_REF v5 vref 68k
Rp1_REF vref 0 {10k*kvn}
Rp2_REF vref P010 {10k*kvr}
Q5_REF P010 N008 0 0 Q2N3904
Rb5_REF N008 l 10k
Cr_REF vref 0 100n
Rled_ENC v5 P011 220
Dled_ENC P011 0 DIR
Rpe_ENC v5 enc 10k
XXu7_ENC enc_eref enc v5 0 enc_eq LM393  ; pins In+ In- V+ V- OUT
Ru1_ENC v5 enc_eref 10k
Ru2_ENC enc_eref 0 10k
Rpq_ENC v5 enc_eq 10k
Rhe_ENC enc_eq enc_eref 1Meg
Cd_ENC enc_tg enc_eq 1n
Rtg_ENC v5 enc_tg 10k
Dcl_ENC enc_tg v5 D1N4148
XX7_ENC 0 enc_tg enc_mono v5 N009 enc_dis7 enc_dis7 v5 NE555  ; pins GND TRIG OUT RST CV THRS DIS Vcc
Rt7_ENC v5 enc_dis7 20k
Ct7_ENC enc_dis7 0 10n
Ccvm_ENC N009 0 10n
XXb1_ENC enc_mono N010 v5 HC_BUF  ; pins a y vcc
Rfv_ENC enc_vf1 N010 10k
Cfv_ENC enc_vf1 0 1u
Rfv2_ENC vspd enc_vf1 10k
Cfv2_ENC vspd 0 1u
XXbr_ERR vref err_vrb vm 0 err_vrb LM358  ; pins In+ In- V+ V- OUT
XXbs_ERR vspd err_vsb vm 0 err_vsb LM358  ; pins In+ In- V+ V- OUT
XXbo_ERR err_voff err_vob vm 0 err_vob LM358  ; pins In+ In- V+ V- OUT
Rv1_ERR v5 err_voff 4.7k
Rv2_ERR err_voff 0 5.1k
Cv_ERR err_voff 0 100n
R1_ERR N011 err_vsb 10k
R3_ERR N012 err_vrb 10k
R4_ERR err_vob N012 {Kerr*10k}
Rf6_ERR err_oa N011 {Kerr*10k}
Cf6_ERR err_oa N011 10n
XXu2b_ERR N012 N011 vm 0 err_oa LM358  ; pins In+ In- V+ V- OUT
Ro_ERR vctrl err_oa 1k
Cvc_ERR vctrl 0 100n
XX5_PWM 0 pwm_tri pwm_tri_o v5 pwm_cv pwm_tri N013 v5 NE555  ; pins GND TRIG OUT RST CV THRS DIS Vcc
Ra5_PWM v5 N013 1k
Rb5_PWM N013 pwm_tri 10k
Ct_PWM pwm_tri 0 10n
Ccv_PWM pwm_cv 0 10n
XXu6_PWM vctrl pwm_tri v5 0 pwm LM393  ; pins In+ In- V+ V- OUT
Rpu_PWM v5 pwm 10k
XXa5_POT pwm m N014 v5 HC_AND2  ; pins a b y vcc
Q3_POT v5 N014 N015 0 Q2N3904
Q4_POT 0 N014 N015 0 Q2N3906
Rg_POT pot_gate N015 47
Rpd_POT pot_gate 0 10k
M1_POT dm pot_gate sh sh IRFZ44N_P
Dfw_POT dm vm D1N5819
Rsh_POT sh 0 0.5
Rb_ALA P012 f 1k
Q6_ALA P013 P012 0 0 Q2N3904
Rbz_ALA vm P013 400
Rl_ALA f P014 470
Dl_ALA P014 0 DLED
V12 vin 0 PWL(0 0 10m 12)
D1 vin vm D1N4007
Cin vm 0 1000u
Ve ein 0 PWL(0 0 0.05 0 0.0501 5)
Vg gin 0 PWL(0 0 0.05 0 0.0501 5 1.40 5 1.4001 0 1.60 0 1.6001 5)
Vr rin 0 PWL(0 0 2.60 0 2.6001 5 2.75 5 2.7501 0 3.55 0 3.5501 5 3.70 5 3.7001 0 4.20 0 4.2001 5 4.35 5 4.3501 0)
Iph v5 b PWL(0 2u 0.6 2u 0.6001 50u 1.1 50u 1.1001 2u)
Vtc tc 0 PWL(0 25 3.0 25 3.5 60 3.8 25)
Bn v5 tnode I=V(v5,tnode)/(10k*exp(3950*(1/(V(tc)+273.15)-1/298.15)))
Bsl encs 0 V=0.3+4.4*u(sin(2*pi*V(ph)))
Renc encs enc 1k
Lm vm P015 3m
Rm P015 n2 12
B§Eb n2 dm V=Ke*V(w)
Cw w 0 {J} ic=0
Bw 0 w I=Ke*I(Lm)-Bfr*V(w)-V(tl)*tanh(V(w))
Vtl tl 0 PWL(0 0.004 1.9 0.004 1.9001 0.03 2.3 0.03 2.3001 0.004)
Cph ph 0 1 ic=0
Bph 0 ph I=20*V(w)/(2*pi)
.model D D
.lib standard.dio
.model NPN NPN
.model PNP PNP
.lib standard.bjt
.model NMOS NMOS
.model PMOS PMOS
.lib standard.mos
* BLOQUE 1 - REGULADOR DE 5 V
* vm (12 V despues del diodo) -> v5 (5 V). El Zener fija 5.6 V en la base de Q1 y la salida es esa tension menos 0.7 V.
* Rtr (trimpot de 100 ohm) sube la salida unas decenas de mV para llevarla a 5.0 V.
* DZ = Zener 1N4734A (5.6 V, 1 W). Q1 = BD139 con disipador: en el peor caso (13 V, 120 mA) disipa ~0.9 W.
* Cout (100 uF) y C2 (100 nF) filtran la salida. La resistencia Rz (510 ohm) deja ~9 mA en el Zener.
* BLOQUE 2 - SENSOR OPTICO IR
* El fototransistor (TCRT5000) inyecta su corriente en el nodo b. Q2 (emisor comun) la amplifica.
* El comparador (con histeresis por Rh) pone p = 1 cuando hay objeto.
* LED infrarrojo (~14 mA)
* trimpot 10k
* histeresis
* pull-up
* Sin objeto: ~2 uA -> c queda en ~4.2 V (sobre el umbral) y p = 0. Con objeto: ~50 uA -> c baja a ~2.9 V y p = 1.
* Ganancia de Q2 = -Rc / (re + RE) = -680 / (14 + 150) = -4. El trimpot mueve el umbral entre 2.9 V y 3.9 V.
* BLOQUE 3 - SOBRECORRIENTE
* La caida en el shunt (0.5 ohm, nodo sh) la amplifica el LM358: ganancia 1 + Rf/Rg = 7.8.
* D1 y Cpk guardan el pico; Rd y Cd retrasan ~0.1 s (ignora el arranque); el comparador baja setn si hay falla.
* trimpot 10k
* Corriente de disparo ~ (Vref + 0.6 V) / (0.5 ohm x 7.8). Con Vref = 2 V: ~0.67 A. El trimpot Rp ajusta Vref.
* Cd = 10 uF con Rd = 10k da ~0.1 s de retardo: el arranque del motor (~30 ms) no dispara, una sobrecarga sostenida si.
* BLOQUE 4 - SOBRETEMPERATURA
* El NTC de 10k va entre v5 y tnode; Rfix completa el divisor, asi tnode sube al calentarse.
* Si tnode supera el umbral (trimpot, 45 a 55 C) el comparador baja setn. Rh da ~2.6 C de histeresis.
* NTC 10k (externo): v5 -> tnode
* trimpot 10k
* NTC a 50 C = 3.6k -> tnode = 3.7 V. El trimpot mueve Vref de 3.4 V (44 C) a 3.9 V (57 C).
* BLOQUE 5 - LOGICA COMBINACIONAL
* Entradas: E (habilitar), G (cubierta cerrada), P (objeto), setn (falla de corriente o temperatura, activa en bajo) y el boton de reset.
* Salidas: M = E.G.F' N = M.P' L = M.P A = F. F es un pestillo NAND: recuerda la falla hasta pulsar reset.
* Rp: cable roto = 0 (seguro). Rs + C: antirrebote (1 ms). Dos inversores Schmitt (74HC14): senal limpia.
* reset automatico al encender
* pestillo (74HC00): setn = 0 pone F = 1
* P' = NAND(P,P)
* decision (74HC08)
* BLOQUE 9 - REFERENCIA DE VELOCIDAD
* Rt y el trimpot Rp1 fijan la referencia normal (~0.53 V).
* Si l = 1, Q5 conecta Rp2 y baja vref a la mitad (velocidad reducida).
* Rp1 y Rp2 son dos trimpots de 10k (normal y reducida): en la simulacion kvn y kvr indican la posicion del cursor.
* Reducida = 50 % de la normal (el enunciado pide entre 40 % y 60 %).
* BLOQUE 8 - ENCODER Y CONVERTIDOR FRECUENCIA-VOLTAJE
* El fototransistor del optointerruptor (nodo enc, con pull-up Rpe) da pulsos al pasar las ranuras del disco. El comparador Xu7 los limpia.
* El 555 monoestable da un pulso fijo de 220 us por cada uno; el filtro RC doble lo vuelve voltaje: vspd = 1.1 mV por Hz.
* LED del optointerruptor
* fototransistor
* tw = 1.1 x Rt7 x Ct7 = 1.1 x 20k x 10 nF = 220 us. Vspd = 5 V x tw x f. A 500 Hz: 0.55 V.
* Dcl protege la entrada del 555 contra el pico positivo del derivador (Cd y Rtg dan un pulso corto en cada flanco de bajada).
* BLOQUE 10 - AMPLIFICADOR DE ERROR (LAZO CERRADO)
* Tres seguidores (Xbr, Xbs, Xbo) aislan vref, la velocidad medida y el nivel Voff. Xu2b resta y multiplica por Kerr = 10:
* vctrl = Kerr (vref - vspd) + Voff. Si la velocidad baja, vctrl sube y el PWM da mas potencia al motor.
* Kerr = 10: un error de 0.1 V mueve vctrl 1 V. Voff = 2.6 V es el punto de partida (~55 % de PWM).
* Un solo circuito integrado LM324 (cuatro amplificadores) contiene Xbr, Xbs, Xbo y Xu2b.
* BLOQUE 6 - GENERADOR DE PWM
* El NE555 oscila (~7 kHz): el nodo tri sube y baja entre 1.7 y 3.3 V (rampa).
* El comparador pone pwm = 1 mientras vctrl > tri: a mayor vctrl, pulsos mas anchos.
* f = 1.44 / ((Ra5 + 2 Rb5) Ct) = 1.44 / (21k x 10 nF) = 6.9 kHz. Ciclo de trabajo = (vctrl - 1.7 V) / 1.7 V: vctrl = 2.5 V da ~50 %.
* El pin 3 del 555 (tri_o) no se usa: la rampa se toma del condensador Ct.
* BLOQUE 7 - SEGURIDAD, EXCITADOR Y MOSFET
* La compuerta AND deja pasar el PWM solo si M = 1: la seguridad manda sobre el PWM.
* Q3 y Q4 (seguidor complementario) cargan y descargan la compuerta de M1. Dfw protege contra el pico del motor.
* El motor va entre vm y dm. Con M1 encendido la corriente baja por el motor, M1 y el shunt Rsh (0.5 ohm, 5 W).
* Al apagar M1 el motor sigue empujando corriente: pasa por Dfw (Schottky 1N5819) de dm a vm.
* M1 = IRFZ44N: con 4.3 V en la compuerta conduce con ~0.07 ohm (con 10 V seria 0.02). Rg limita la corriente de la compuerta.
* BLOQUE 11 - ALARMA
* Cuando f = 1 (falla enclavada), Q6 conduce como interruptor y enciende el buzzer de 12 V
* (en la simulacion el buzzer se representa con Rbz de 400 ohm). El LED indica la falla con luz.
* buzzer activo 12 V (~30 mA)
* LED rojo (~8 mA)
* Ib = (4.9 - 0.7 V) / 1k = 4 mA. Ic = 30 mA. Ic/Ib = 7.5, menor que hFE: el transistor trabaja saturado, como interruptor.
* ENTRADAS DE PRUEBA, FUENTE Y MOTOR (para simular)
* La fuente de 12 V, los eventos (objeto, cubierta, carga extra, calor, reset) y el motor estan aqui; los bloques se unen a ellos por el nombre de la etiqueta azul.
* Entrada: fuente externa de 12 V.
* D1 protege contra polaridad inversa.
* E, G (cubierta) y boton de reset con su guion de eventos.
* fototransistor: 2 uA sin objeto, 50 uA con objeto (0.6 a 1.1 s)
* NTC 10 k (B 3950): temperatura 25 C -> 60 C entre 3.0 y 3.5 s
* encoder de 20 ranuras
* motor DC 12 V (modelo supuesto): Ra 12, La 3 mH, Ke = Kt = 0.035
* w = velocidad (rad/s) como voltaje; ph = fase del disco del encoder
* SISTEMA COMPLETO - MINIESTACION INDUSTRIAL AUTOMATIZADA (esquematico completo, se simula con Run)
.param Kerr=10
.param kir=0.55
.param koc=0.2
.param ktm=0.5
.param kvn=0.8 kvr=0.7
.include ..\3_archivos_tecnicos\modelos.inc
.include ..\3_archivos_tecnicos\sistema.inc
.lib NE555.sub
.param Ke=0.035 J=1e-5 Bfr=7.2e-6
.tran 0 4.6 0 4u startup
.save V(v5) V(vm) V(p) V(setn) V(m) V(n) V(l) V(f) V(fn) V(vref) V(vspd) V(vctrl) V(pwm) V(dm) V(sh) V(tnode) V(tc) V(w) I(Lm) I(D1)
.lib NE555.sub
.backanno
.end